# Altium project Main_Board.PrjPcb (part 11 of 44)

## Sheet SPI_Muxes.SchDoc: SPI_Muxes
size A3; Organization: Altium Limited; Address1: L3, 12a Rodborough Rd; Address2: Frenchs Forest; Address3: NSW; Address4: Australia 2086
Used 2 times, as channels HighSpeed/SPI_bridge_PCIe, SPI_bridge_Main. Parts and nets are listed once, with the designators drawn on the sheet.
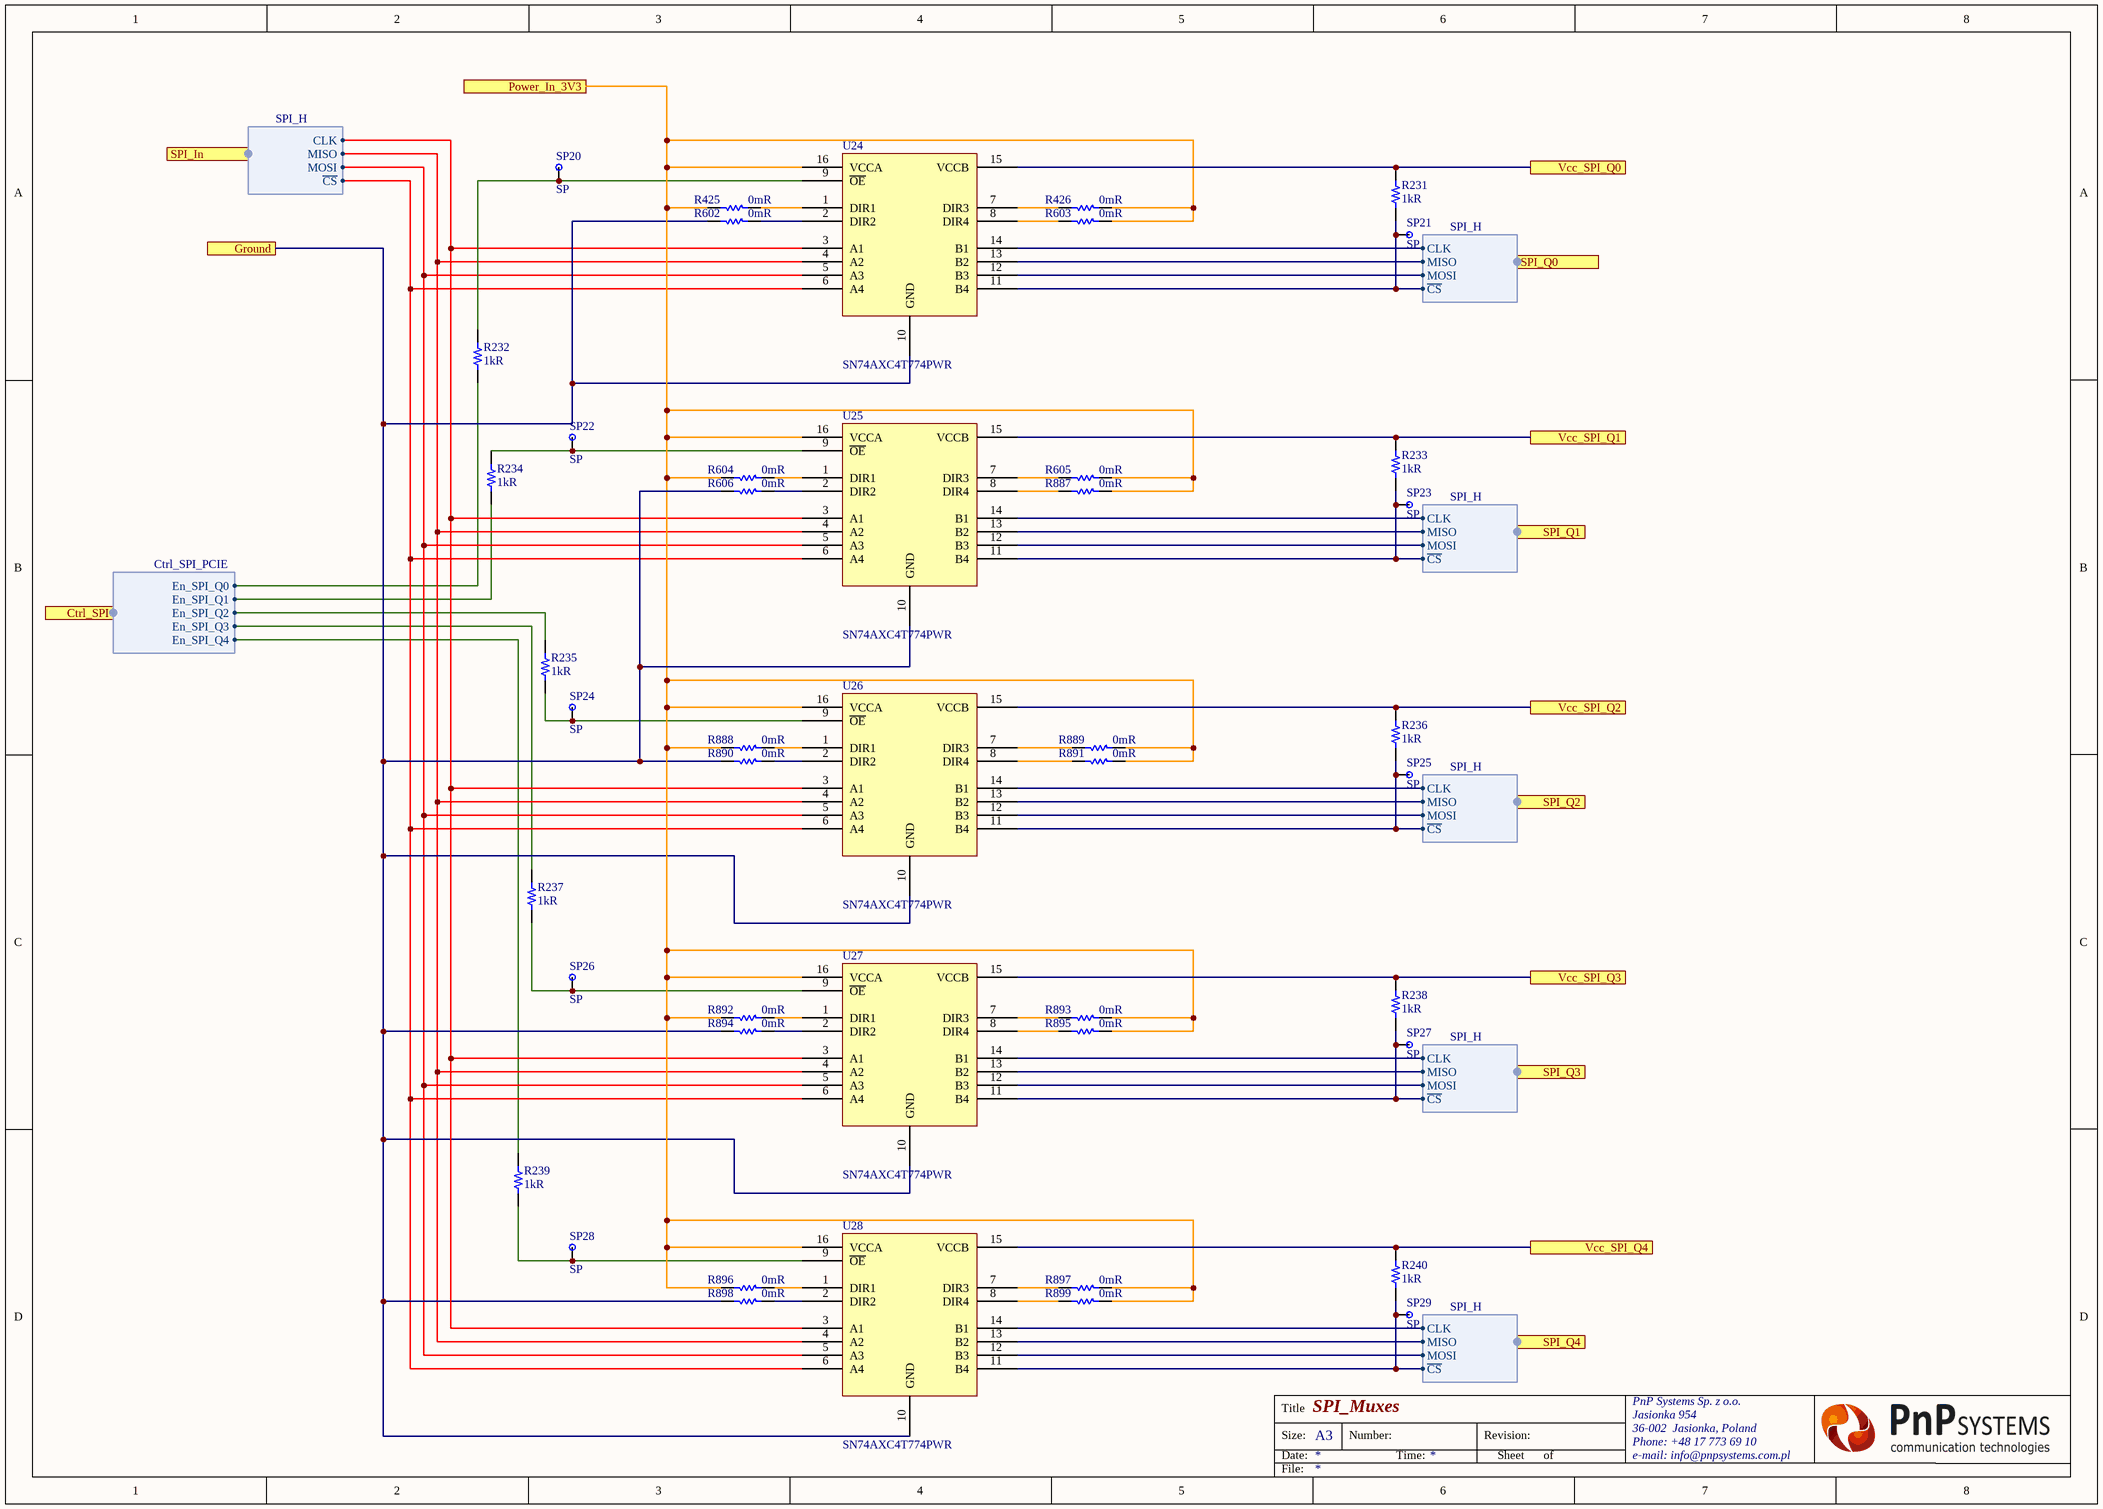
[diagram p17: SPI_Muxes.SchDoc]

### Parts
R231  1kR  [RES 0402/1005 RF KK]
R232  1kR  [RES 0402/1005 RF KK]
R233  1kR  [RES 0402/1005 RF KK]
R234  1kR  [RES 0402/1005 RF KK]
R235  1kR  [RES 0402/1005 RF KK]
R236  1kR  [RES 0402/1005 RF KK]
R237  1kR  [RES 0402/1005 RF KK]
R238  1kR  [RES 0402/1005 RF KK]
R239  1kR  [RES 0402/1005 RF KK]
R240  1kR  [RES 0402/1005 RF KK]
R425  0mR  [RES 0402/1005 RF KK]
R426  0mR  [RES 0402/1005 RF KK]
R602  0mR  [RES 0402/1005 RF KK]
R603  0mR  [RES 0402/1005 RF KK]
R604  0mR  [RES 0402/1005 RF KK]
R605  0mR  [RES 0402/1005 RF KK]
R606  0mR  [RES 0402/1005 RF KK]
R887  0mR  [RES 0402/1005 RF KK]
R888  0mR  [RES 0402/1005 RF KK]
R889  0mR  [RES 0402/1005 RF KK]
R890  0mR  [RES 0402/1005 RF KK]
R891  0mR  [RES 0402/1005 RF KK]
R892  0mR  [RES 0402/1005 RF KK]
R893  0mR  [RES 0402/1005 RF KK]
R894  0mR  [RES 0402/1005 RF KK]
R895  0mR  [RES 0402/1005 RF KK]
R896  0mR  [RES 0402/1005 RF KK]
R897  0mR  [RES 0402/1005 RF KK]
R898  0mR  [RES 0402/1005 RF KK]
R899  0mR  [RES 0402/1005 RF KK]
SP20  SP  [MeasureTP]
SP21  SP  [MeasureTP]
SP22  SP  [MeasureTP]
SP23  SP  [MeasureTP]
SP24  SP  [MeasureTP]
SP25  SP  [MeasureTP]
SP26  SP  [MeasureTP]
SP27  SP  [MeasureTP]
SP28  SP  [MeasureTP]
SP29  SP  [MeasureTP]
U24  SN74AXC4T774PWR  [SN74AXC4T774PWR]
U25  SN74AXC4T774PWR  [SN74AXC4T774PWR]
U26  SN74AXC4T774PWR  [SN74AXC4T774PWR]
U27  SN74AXC4T774PWR  [SN74AXC4T774PWR]
U28  SN74AXC4T774PWR  [SN74AXC4T774PWR]

### Ports
Ctrl_SPI (harness Ctrl_SPI_PCIE), Ground, Power_In_3V3, SPI_In (harness SPI_H), SPI_Q0 (harness SPI_H), SPI_Q1 (harness SPI_H), SPI_Q2 (harness SPI_H), SPI_Q3 (harness SPI_H), SPI_Q4 (harness SPI_H), Vcc_SPI_Q0, Vcc_SPI_Q1, Vcc_SPI_Q2, Vcc_SPI_Q3, Vcc_SPI_Q4

### Harnesses
SPI_H: CLK, MISO, MOSI, ~{CS}
Ctrl_SPI_PCIE: En_SPI_Q0, En_SPI_Q1, En_SPI_Q2, En_SPI_Q3, En_SPI_Q4

### Nets
Ground: R602.2 R606.2 R890.2 R894.2 R898.2 U24.10(GND) U25.10(GND) U26.10(GND) U27.10(GND) U28.10(GND) ; port Ground
Power_In_3V3: R425.2 R426.1 R603.1 R604.2 R605.1 R887.1 R888.2 R889.1 R891.1 R892.2 R893.1 R895.1 R896.2 R897.1 R899.1 U24.16(VCCA) U25.16(VCCA) U26.16(VCCA) U27.16(VCCA) U28.16(VCCA) ; port Power_In_3V3
Vcc_SPI_Q0: R231.2 U24.15(VCCB) ; port Vcc_SPI_Q0
Vcc_SPI_Q1: R233.2 U25.15(VCCB) ; port Vcc_SPI_Q1
Vcc_SPI_Q2: R236.2 U26.15(VCCB) ; port Vcc_SPI_Q2
Vcc_SPI_Q3: R238.2 U27.15(VCCB) ; port Vcc_SPI_Q3
Vcc_SPI_Q4: R240.2 U28.15(VCCB) ; port Vcc_SPI_Q4
NetR231_1: R231.1 SP21.1 U24.11(B4) ; port SPI_Q0.~{CS}
NetR232_1: R232.1 ; port Ctrl_SPI.En_SPI_Q0
NetR232_2: R232.2 SP20.1 U24.9(~{OE})
NetR233_1: R233.1 SP23.1 U25.11(B4) ; port SPI_Q1.~{CS}
NetR234_1: R234.1 ; port Ctrl_SPI.En_SPI_Q1
NetR234_2: R234.2 SP22.1 U25.9(~{OE})
NetR235_1: R235.1 SP24.1 U26.9(~{OE})
NetR235_2: R235.2 ; port Ctrl_SPI.En_SPI_Q2
NetR236_1: R236.1 SP25.1 U26.11(B4) ; port SPI_Q2.~{CS}
NetR237_1: R237.1 SP26.1 U27.9(~{OE})
NetR237_2: R237.2 ; port Ctrl_SPI.En_SPI_Q3
NetR238_1: R238.1 SP27.1 U27.11(B4) ; port SPI_Q3.~{CS}
NetR239_1: R239.1 ; port Ctrl_SPI.En_SPI_Q4
NetR239_2: R239.2 SP28.1 U28.9(~{OE})
NetR240_1: R240.1 SP29.1 U28.11(B4) ; port SPI_Q4.~{CS}
NetR425_1: R425.1 U24.1(DIR1)
NetR426_2: R426.2 U24.7(DIR3)
NetR602_1: R602.1 U24.2(DIR2)
NetR603_2: R603.2 U24.8(DIR4)
NetR604_1: R604.1 U25.1(DIR1)
NetR605_2: R605.2 U25.7(DIR3)
NetR606_1: R606.1 U25.2(DIR2)
NetR887_2: R887.2 U25.8(DIR4)
NetR888_1: R888.1 U26.1(DIR1)
NetR889_2: R889.2 U26.7(DIR3)
NetR890_1: R890.1 U26.2(DIR2)
NetR891_2: R891.2 U26.8(DIR4)
NetR892_1: R892.1 U27.1(DIR1)
NetR893_2: R893.2 U27.7(DIR3)
NetR894_1: R894.1 U27.2(DIR2)
NetR895_2: R895.2 U27.8(DIR4)
NetR896_1: R896.1 U28.1(DIR1)
NetR897_2: R897.2 U28.7(DIR3)
NetR898_1: R898.1 U28.2(DIR2)
NetR899_2: R899.2 U28.8(DIR4)
NetU24_3: U24.3(A1) U25.3(A1) U26.3(A1) U27.3(A1) U28.3(A1) ; port SPI_In.CLK
NetU24_4: U24.4(A2) U25.4(A2) U26.4(A2) U27.4(A2) U28.4(A2) ; port SPI_In.MISO
NetU24_5: U24.5(A3) U25.5(A3) U26.5(A3) U27.5(A3) U28.5(A3) ; port SPI_In.MOSI
NetU24_6: U24.6(A4) U25.6(A4) U26.6(A4) U27.6(A4) U28.6(A4) ; port SPI_In.~{CS}
NetU24_12: U24.12(B3) ; port SPI_Q0.MOSI
NetU24_13: U24.13(B2) ; port SPI_Q0.MISO
NetU24_14: U24.14(B1) ; port SPI_Q0.CLK
NetU25_12: U25.12(B3) ; port SPI_Q1.MOSI
NetU25_13: U25.13(B2) ; port SPI_Q1.MISO
NetU25_14: U25.14(B1) ; port SPI_Q1.CLK
NetU26_12: U26.12(B3) ; port SPI_Q2.MOSI
NetU26_13: U26.13(B2) ; port SPI_Q2.MISO
NetU26_14: U26.14(B1) ; port SPI_Q2.CLK
NetU27_12: U27.12(B3) ; port SPI_Q3.MOSI
NetU27_13: U27.13(B2) ; port SPI_Q3.MISO
NetU27_14: U27.14(B1) ; port SPI_Q3.CLK
NetU28_12: U28.12(B3) ; port SPI_Q4.MOSI
NetU28_13: U28.13(B2) ; port SPI_Q4.MISO
NetU28_14: U28.14(B1) ; port SPI_Q4.CLK

### Channels
HighSpeed/SPI_bridge_PCIe: designators end in _SPI_bridge_PCIe; ports Ground=B503_Ground Power_In_3V3=3V3_RAIL Vcc_SPI_Q0=3V3_RAIL Vcc_SPI_Q1=3V3_RAIL Vcc_SPI_Q2=3V3_RAIL Vcc_SPI_Q3=3V3_RAIL Vcc_SPI_Q4=3V3_RAIL
SPI_bridge_Main: designators end in _SPI_bridge_Main; ports Ground=B503_Ground Power_In_3V3=3V3_RAIL Vcc_SPI_Q0=3V3_RAIL Vcc_SPI_Q1=3V3_RAIL Vcc_SPI_Q2=3V3_RAIL Vcc_SPI_Q3=3V3_RAIL Vcc_SPI_Q4=3V3_RAIL

### Notes on the sheet
- Title
- Size:
- Date:
- A3
- Number:
- Time:
- Revision:
- Sheet
- of
- File:

### Library data of the parts
R231-R240 = Resistor: Manufacturer: Panasonic; Manufacturer Part Number: ERJ-2RKF1001X; Tolerance: 1%; Power Rating: 100mW; Temperature Coefficient: 100ppm/°C; Voltage Rating: 50V; Supplier 1: Digi-Key; Supplier Part Number 1: P1.00KLCT-ND; Stock 1: 6683975; Pricing 1: 1 = 0,10000, 10 = 0,05200, 100 = 0,02130, 1000 = 0,00958, 2500 = 0,00832, 5000 = 0,00687 (USD); RoHS: Yes; Mount: Surface Mount; Case/Package: 0402; Number of Pins: 2; Case Code (Imperial): 0402; Case Code (Metric): 1005; Contact Plating: Tin; Min Operating Temperature: -55°C; Max Operating Temperature: 155°C; Resistance: 1kR; Packaging: Tape and Reel; Composition: Thick Film; Termination: SMD/SMT; Package Quantity: 1; Military Standard: Not; Number of Terminations: 2; Max Power Dissipation: 100mW; Voltage Rating (DC): 50V; Features: Automotive AEC-Q200; Working Voltage: 50V; Length: 1mm; Height: 0.35mm; Width: 0.5mm; Depth: 0.5mm; Radiation Hardening: No; Lead Free: Lead Free; REACH SVHC: No SVHC; ComponentLink1URL: https://datasheet.ciiva.com/11821/0900766b80f80784-11821203.pdf?src-supplier=RSComponents; ComponentLink1Description: https://datasheet.ciiva.com/11821/0900766b80f80784-11821203.pdf?src-supplier=RSComponents; ComponentLink2URL: https://datasheet.ciiva.com/16767/70260748-16767559.pdf?src-supplier=Allied+Electronics; ComponentLink2Description: https://datasheet.ciiva.com/16767/70260748-16767559.pdf?src-supplier=Allied+Electronics; ComponentLink3URL: https://datasheet.ciiva.com/9198/aoa0000ce2-9198920.pdf?src-supplier=Avnet; ComponentLink3Description: https://datasheet.ciiva.com/9198/aoa0000ce2-9198920.pdf?src-supplier=Avnet; ComponentLink4URL: https://datasheet.ciiva.com/7942/aoa0000ce2-7942426.pdf?src-supplier=Element14; ComponentLink4Description: https://datasheet.ciiva.com/7942/aoa0000ce2-7942426.pdf?src-supplier=Element14; ComponentLink5URL: https://datasheet.ciiva.com/16771/70260748-16771979.pdf?src-supplier=Allied+Electronics; ComponentLink5Description: https://datasheet.ciiva.com/16771/70260748-16771979.pdf?src-supplier=Allied+Electronics; ComponentLink6URL: https://datasheet.ciiva.com/17215/aoa0000ce2-17215308.pdf?src-supplier=Avnet+Europe; ComponentLink6Description: https://datasheet.ciiva.com/17215/aoa0000ce2-17215308.pdf?src-supplier=Avnet+Europe; ComponentLink7URL: https://datasheet.ciiva.com/28532/1678782-28532109.pdf?src-supplier=Element14; ComponentLink7Description: https://datasheet.ciiva.com/28532/1678782-28532109.pdf?src-supplier=Element14; ComponentLink8URL: https://datasheet.ciiva.com/16523/aoa0000ce2-16523834.pdf?src-supplier=Avnet+Asia; ComponentLink8Description: https://datasheet.ciiva.com/16523/aoa0000ce2-16523834.pdf?src-supplier=Avnet+Asia; ComponentLink9URL: https://datasheet.ciiva.com/22673/1678782-22673916.pdf?src-supplier=Element14; ComponentLink9Description: https://datasheet.ciiva.com/22673/1678782-22673916.pdf?src-supplier=Element14
R425 R426 R602-R606 R887-R899 = Resistor: Manufacturer 1: Yageo; Manufacturer Part Number 1: RC0402JR-070RL; Power Rating: 62.5mW; Tolerance: 5%; Voltage Rating: 50V; Max Power Dissipation: 63mW; Temperature Coefficient: 200ppm/°C; Supplier 1: Digi-Key; Supplier Part Number 1: 311-0.0JRCT-ND; Stock 1: 69822252; Pricing 1: 1=0.10000, 10=0.01200, 25=0.00920, 50=0.00680, 100=0.00510, 250=0.00388, 500=0.00308, 1000=0.00227, 5000=0.00163 (USD); RoHS: Yes; Case/Package: 0402; Contact Plating: Tin,Matte; Case Code (Metric): 1005; Case Code (Imperial): 0402; Min Operating Temperature: -55°C; Max Operating Temperature: 155°C; Resistance: 0mR; Packaging: Tape and Reel; Composition: Thick Film; Package Quantity: 1; Number of Terminations: 2; Termination: SMD/SMT; Military Standard: Not; Features: Moisture Resistant; Length: 1mm; Height: 0.016inch; Width: 0.02inch; Depth: 0.5mm; Radiation Hardening: No; REACH SVHC: Unknown; Lead Free: Lead Free; ComponentLink1URL: https://datasheet.ciiva.com/2452/pyu-rc0402-51-rohs-l-6-2452608.pdf?src-supplier=Digi-Key; ComponentLink1Description: https://datasheet.ciiva.com/2452/pyu-rc0402-51-rohs-l-6-2452608.pdf?src-supplier=Digi-Key; ComponentLink2URL: https://datasheet.ciiva.com/11808/0900766b80c66297-11808195.pdf?src-supplier=RSComponents; ComponentLink2Description: https://datasheet.ciiva.com/11808/0900766b80c66297-11808195.pdf?src-supplier=RSComponents; ComponentLink3URL: https://datasheet.ciiva.com/2452/pyu-r-int-thick-7-2452609.pdf?src-supplier=Digi-Key; ComponentLink3Description: https://datasheet.ciiva.com/2452/pyu-r-int-thick-7-2452609.pdf?src-supplier=Digi-Key; ComponentLink4URL: https://datasheet.ciiva.com/22747/1018594-22747515.pdf?src-supplier=Element14; ComponentLink4Description: https://datasheet.ciiva.com/22747/1018594-22747515.pdf?src-supplier=Element14; ComponentLink5URL: https://datasheet.ciiva.com/7983/1018594-7983535.pdf?src-supplier=Element14; ComponentLink5Description: https://datasheet.ciiva.com/7983/1018594-7983535.pdf?src-supplier=Element14; ComponentLink6URL: https://datasheet.ciiva.com/2452/pyu-r-int-thick-7-2452610.pdf?src-supplier=Digi-Key; ComponentLink6Description: https://datasheet.ciiva.com/2452/pyu-r-int-thick-7-2452610.pdf?src-supplier=Digi-Key; ComponentLink7URL: https://datasheet.ciiva.com/8896/pyu-rc0402-51-rohs-l-6-8896201.pdf?src-supplier=Avnet; ComponentLink7Description: https://datasheet.ciiva.com/8896/pyu-rc0402-51-rohs-l-6-8896201.pdf?src-supplier=Avnet; ComponentLink8URL: https://datasheet.ciiva.com/28386/pyu-rc0402-51-rohs-l-6-28386633.pdf?src-supplier=Avnet+Europe; ComponentLink8Description: https://datasheet.ciiva.com/28386/pyu-rc0402-51-rohs-l-6-28386633.pdf?src-supplier=Avnet+Europe; ComponentLink9URL: https://datasheet.ciiva.com/15189/getdatasheetpartid-326379-15189533.pdf?src-supplier=Verical; ComponentLink9Description: https://datasheet.ciiva.com/15189/getdatasheetpartid-326379-15189533.pdf?src-supplier=Verical
U24-U28 = SN74AXC4T774PWR: Manufacturer 1: Texas Instruments; Supplier 1: Digi-Key; Manufacturer Part Number 1: SN74AXC4T774PWR; Stock 1: 2000; Pricing 1: 1=1,14000, 10=1,01500, 100=0,79120, 500=0,65364, 1000=0,51603 (USD); RoHS: No; Supplier Part Number 1: 296-SN74AXC4T774PWRCT-ND

## Sheet Power4HiSpeed.SchDoc
size A3; Organization: Altium Limited; Address1: L3, 12a Rodborough Rd; Address2: Frenchs Forest; Address3: NSW; Address4: Australia 2086
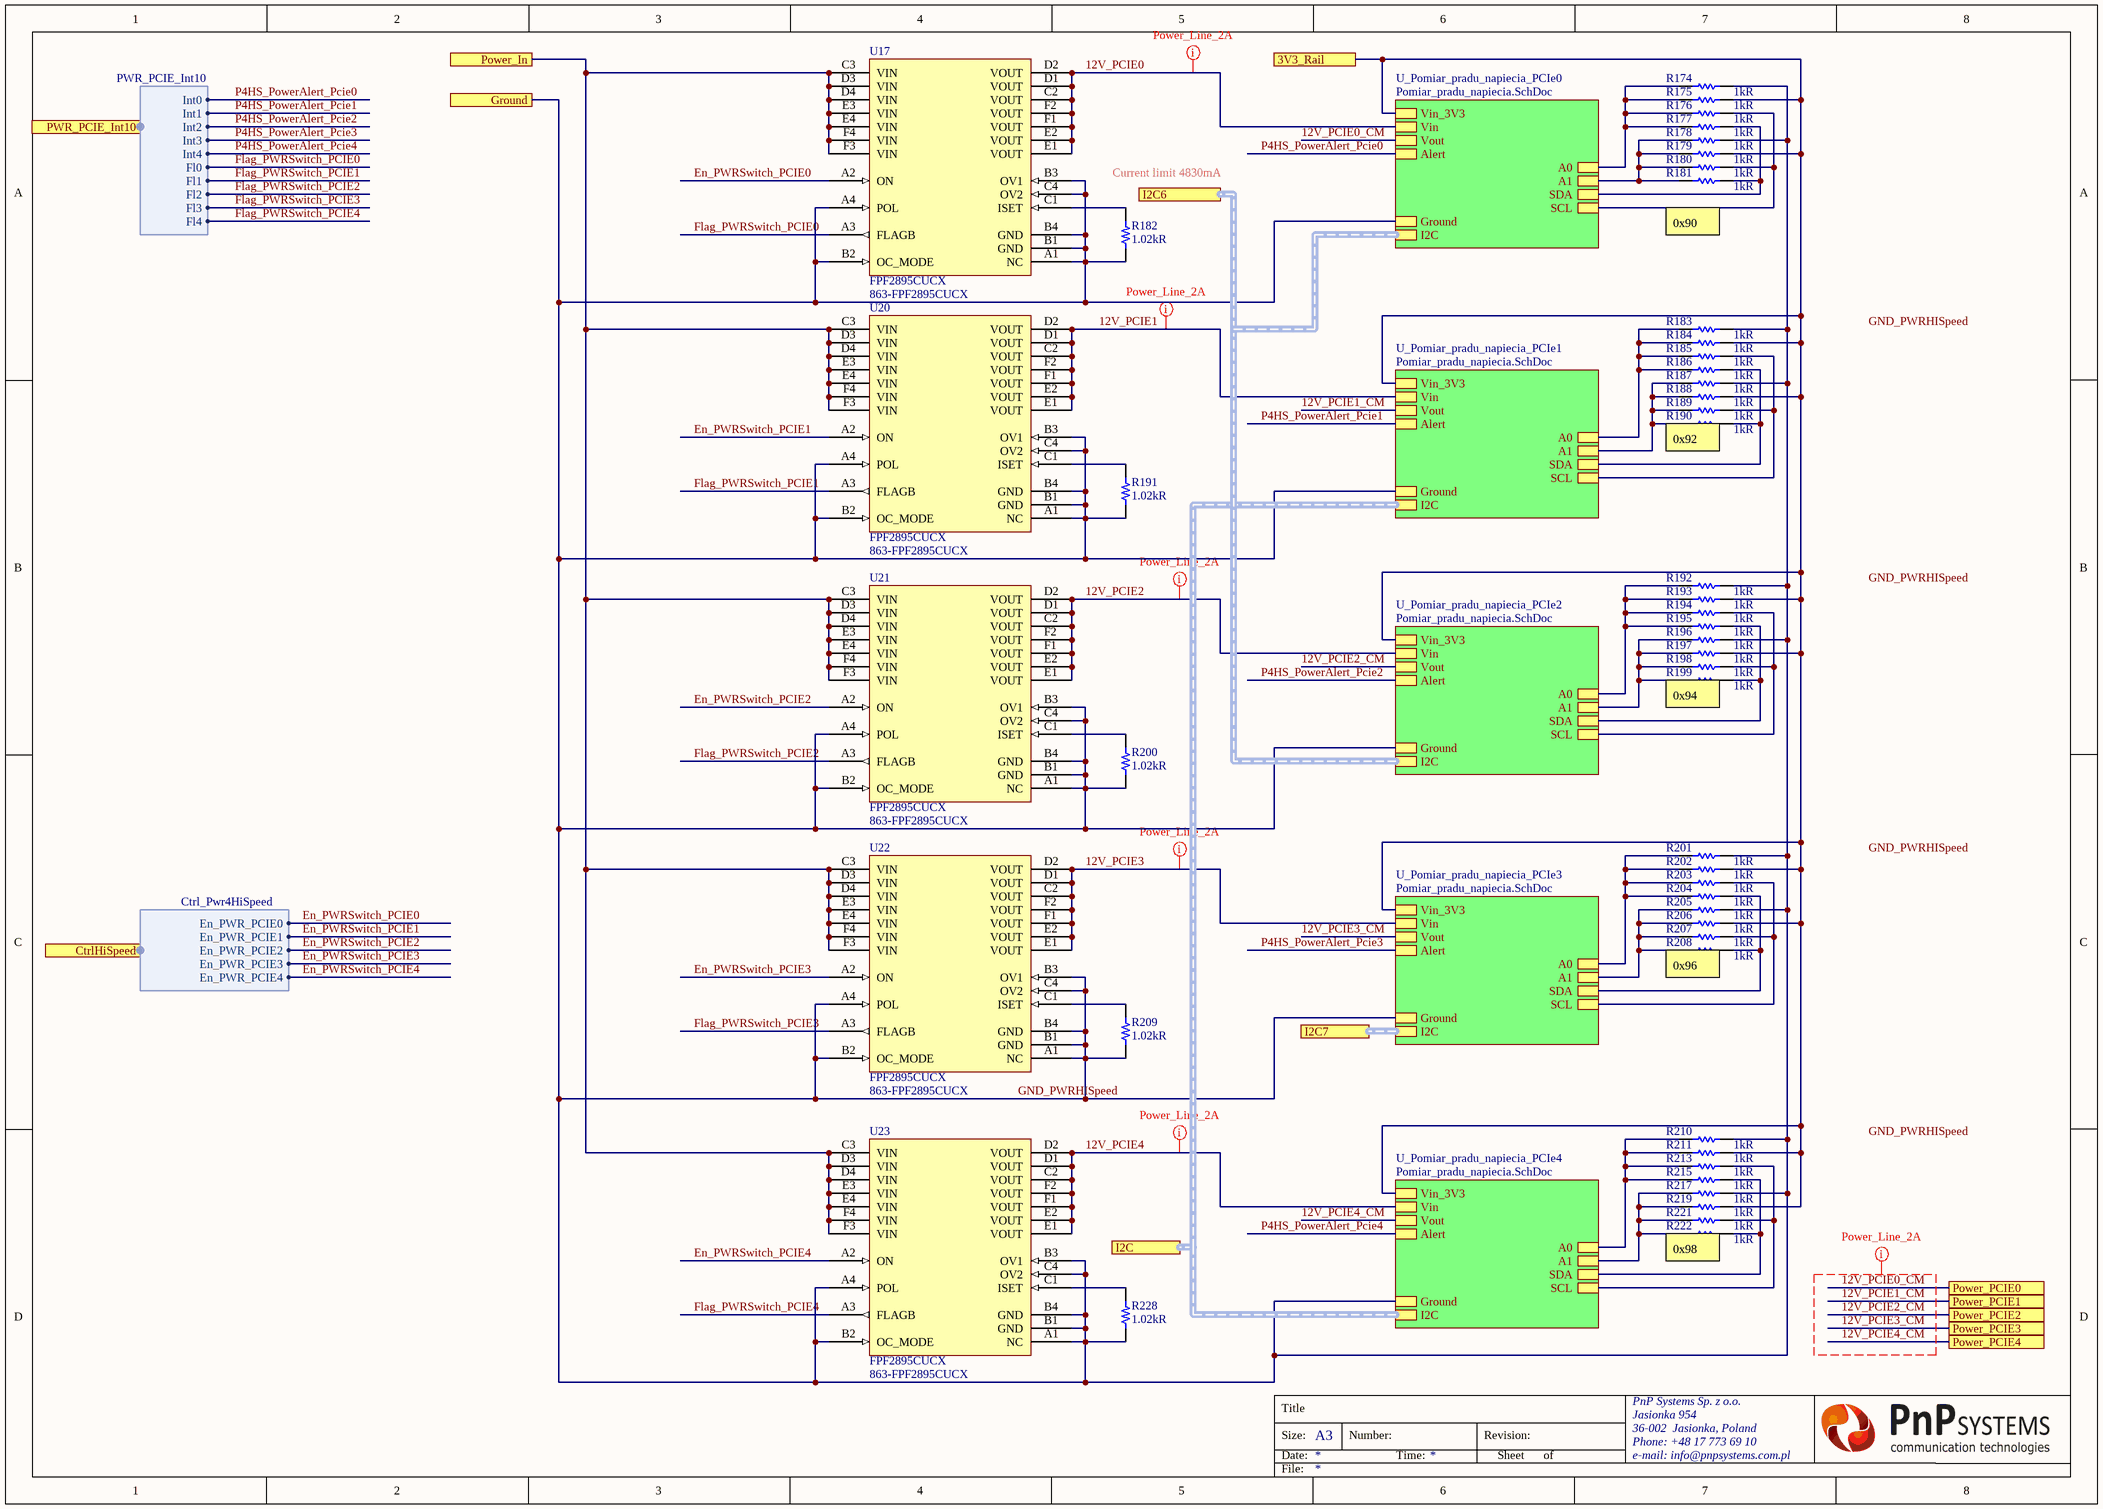
[diagram p18: Power4HiSpeed.SchDoc]

### Parts
R174  1kR  [RES 0402/1005 RF KK]
R175  1kR  [RES 0402/1005 RF KK]
R176  1kR  [RES 0402/1005 RF KK]
R177  1kR  [RES 0402/1005 RF KK]
R178  1kR  [RES 0402/1005 RF KK]
R179  1kR  [RES 0402/1005 RF KK]
R180  1kR  [RES 0402/1005 RF KK]
R181  1kR  [RES 0402/1005 RF KK]
R182  1.02kR  [RES 0402/1005 RF KK]
R183  1kR  [RES 0402/1005 RF KK]
R184  1kR  [RES 0402/1005 RF KK]
R185  1kR  [RES 0402/1005 RF KK]
R186  1kR  [RES 0402/1005 RF KK]
R187  1kR  [RES 0402/1005 RF KK]
R188  1kR  [RES 0402/1005 RF KK]
R189  1kR  [RES 0402/1005 RF KK]
R190  1kR  [RES 0402/1005 RF KK]
R191  1.02kR  [RES 0402/1005 RF KK]
R192  1kR  [RES 0402/1005 RF KK]
R193  1kR  [RES 0402/1005 RF KK]
R194  1kR  [RES 0402/1005 RF KK]
R195  1kR  [RES 0402/1005 RF KK]
R196  1kR  [RES 0402/1005 RF KK]
R197  1kR  [RES 0402/1005 RF KK]
R198  1kR  [RES 0402/1005 RF KK]
R199  1kR  [RES 0402/1005 RF KK]
R200  1.02kR  [RES 0402/1005 RF KK]
R201  1kR  [RES 0402/1005 RF KK]
R202  1kR  [RES 0402/1005 RF KK]
R203  1kR  [RES 0402/1005 RF KK]
R204  1kR  [RES 0402/1005 RF KK]
R205  1kR  [RES 0402/1005 RF KK]
R206  1kR  [RES 0402/1005 RF KK]
R207  1kR  [RES 0402/1005 RF KK]
R208  1kR  [RES 0402/1005 RF KK]
R209  1.02kR  [RES 0402/1005 RF KK]
R210  1kR  [RES 0402/1005 RF KK]
R211  1kR  [RES 0402/1005 RF KK]
R213  1kR  [RES 0402/1005 RF KK]
R215  1kR  [RES 0402/1005 RF KK]
R217  1kR  [RES 0402/1005 RF KK]
R219  1kR  [RES 0402/1005 RF KK]
R221  1kR  [RES 0402/1005 RF KK]
R222  1kR  [RES 0402/1005 RF KK]
R228  1.02kR  [RES 0402/1005 RF KK]
U17  FPF2895CUCX  Supplier Part Number 1: 863-FPF2895CUCX  [FPF2895C-D]
U20  FPF2895CUCX  Supplier Part Number 1: 863-FPF2895CUCX  [FPF2895C-D]
U21  FPF2895CUCX  Supplier Part Number 1: 863-FPF2895CUCX  [FPF2895C-D]
U22  FPF2895CUCX  Supplier Part Number 1: 863-FPF2895CUCX  [FPF2895C-D]
U23  FPF2895CUCX  Supplier Part Number 1: 863-FPF2895CUCX  [FPF2895C-D]

### Sub-sheets
U_Pomiar_pradu_napiecia_PCIe0 = Pomiar_pradu_napiecia.SchDoc: Vin_3V3, Vin, Vout, Alert, A0, A1, SDA, SCL, Ground, I2C (harness I2C)
U_Pomiar_pradu_napiecia_PCIe1 = Pomiar_pradu_napiecia.SchDoc: Vin_3V3, Vin, Vout, Alert, A0, A1, SDA, SCL, Ground, I2C (harness I2C)
U_Pomiar_pradu_napiecia_PCIe2 = Pomiar_pradu_napiecia.SchDoc: Vin_3V3, Vin, Vout, Alert, A0, A1, SDA, SCL, Ground, I2C (harness I2C)
U_Pomiar_pradu_napiecia_PCIe3 = Pomiar_pradu_napiecia.SchDoc: Vin_3V3, Vin, Vout, Alert, A0, A1, SDA, SCL, Ground, I2C (harness I2C)
U_Pomiar_pradu_napiecia_PCIe4 = Pomiar_pradu_napiecia.SchDoc: Vin_3V3, Vin, Vout, Alert, A0, A1, SDA, SCL, Ground, I2C (harness I2C)

### Ports
3V3_Rail, CtrlHiSpeed (harness Ctrl_Pwr4HiSpeed), Ground, I2C6, I2C7, I2C (harness I2C), Power_In, Power_PCIE0, Power_PCIE1, Power_PCIE2, Power_PCIE3, Power_PCIE4, PWR_PCIE_Int10 (harness PWR_PCIE_Int10)

### Harnesses
Ctrl_Pwr4HiSpeed: En_PWR_PCIE0, En_PWR_PCIE1, En_PWR_PCIE2, En_PWR_PCIE3, En_PWR_PCIE4
PWR_PCIE_Int10: Int0, Int1, Int2, Int3, Int4, Fl0, Fl1, Fl2, Fl3, Fl4

### Nets
GND_PWRHISpeed: R174.2 R178.2 R182.1 R183.2 R187.2 R191.1 R192.2 R196.2 R200.1 R201.2 R205.2 R209.1 R210.2 R217.2 R228.1 U17.A1(NC) U17.A4(POL) U17.B1(GND) U17.B2(OC_MODE) U17.B3(OV1) U17.B4(GND) U17.C4(OV2) U20.A1(NC) U20.A4(POL) U20.B1(GND) U20.B2(OC_MODE) U20.B3(OV1) U20.B4(GND) U20.C4(OV2) U21.A1(NC) U21.A4(POL) U21.B1(GND) U21.B2(OC_MODE) U21.B3(OV1) U21.B4(GND) U21.C4(OV2) U22.A1(NC) U22.A4(POL) U22.B1(GND) U22.B2(OC_MODE) U22.B3(OV1) U22.B4(GND) U22.C4(OV2) U23.A1(NC) U23.A4(POL) U23.B1(GND) U23.B2(OC_MODE) U23.B3(OV1) U23.B4(GND) U23.C4(OV2) ; port Ground, sheet U_Pomiar_pradu_napiecia_PCIe0/Ground, sheet U_Pomiar_pradu_napiecia_PCIe1/Ground, sheet U_Pomiar_pradu_napiecia_PCIe2/Ground, sheet U_Pomiar_pradu_napiecia_PCIe3/Ground, sheet U_Pomiar_pradu_napiecia_PCIe4/Ground  [project net B503_Ground]
3V3_RAIL: R175.2 R179.2 R184.2 R188.2 R193.2 R197.2 R202.2 R206.2 R211.2 R219.2 ; port 3V3_Rail, sheet U_Pomiar_pradu_napiecia_PCIe0/Vin_3V3, sheet U_Pomiar_pradu_napiecia_PCIe1/Vin_3V3, sheet U_Pomiar_pradu_napiecia_PCIe2/Vin_3V3, sheet U_Pomiar_pradu_napiecia_PCIe3/Vin_3V3, sheet U_Pomiar_pradu_napiecia_PCIe4/Vin_3V3
12V_LT3042: U17.C3(VIN) U17.D3(VIN) U17.D4(VIN) U17.E3(VIN) U17.E4(VIN) U17.F3(VIN) U17.F4(VIN) U20.C3(VIN) U20.D3(VIN) U20.D4(VIN) U20.E3(VIN) U20.E4(VIN) U20.F3(VIN) U20.F4(VIN) U21.C3(VIN) U21.D3(VIN) U21.D4(VIN) U21.E3(VIN) U21.E4(VIN) U21.F3(VIN) U21.F4(VIN) U22.C3(VIN) U22.D3(VIN) U22.D4(VIN) U22.E3(VIN) U22.E4(VIN) U22.F3(VIN) U22.F4(VIN) U23.C3(VIN) U23.D3(VIN) U23.D4(VIN) U23.E3(VIN) U23.E4(VIN) U23.F3(VIN) U23.F4(VIN) ; port Power_In
12V_PCIE0: U17.C2(VOUT) U17.D1(VOUT) U17.D2(VOUT) U17.E1(VOUT) U17.E2(VOUT) U17.F1(VOUT) U17.F2(VOUT) ; sheet U_Pomiar_pradu_napiecia_PCIe0/Vin
12V_PCIE0_CM: port Power_PCIE0, sheet U_Pomiar_pradu_napiecia_PCIe0/Vout
12V_PCIE1: U20.C2(VOUT) U20.D1(VOUT) U20.D2(VOUT) U20.E1(VOUT) U20.E2(VOUT) U20.F1(VOUT) U20.F2(VOUT) ; sheet U_Pomiar_pradu_napiecia_PCIe1/Vin
12V_PCIE1_CM: port Power_PCIE1, sheet U_Pomiar_pradu_napiecia_PCIe1/Vout
12V_PCIE2: U21.C2(VOUT) U21.D1(VOUT) U21.D2(VOUT) U21.E1(VOUT) U21.E2(VOUT) U21.F1(VOUT) U21.F2(VOUT) ; sheet U_Pomiar_pradu_napiecia_PCIe2/Vin
12V_PCIE2_CM: port Power_PCIE2, sheet U_Pomiar_pradu_napiecia_PCIe2/Vout
12V_PCIE3: U22.C2(VOUT) U22.D1(VOUT) U22.D2(VOUT) U22.E1(VOUT) U22.E2(VOUT) U22.F1(VOUT) U22.F2(VOUT) ; sheet U_Pomiar_pradu_napiecia_PCIe3/Vin
12V_PCIE3_CM: port Power_PCIE3, sheet U_Pomiar_pradu_napiecia_PCIe3/Vout
12V_PCIE4: U23.C2(VOUT) U23.D1(VOUT) U23.D2(VOUT) U23.E1(VOUT) U23.E2(VOUT) U23.F1(VOUT) U23.F2(VOUT) ; sheet U_Pomiar_pradu_napiecia_PCIe4/Vin
12V_PCIE4_CM: port Power_PCIE4, sheet U_Pomiar_pradu_napiecia_PCIe4/Vout
En_PWRSwitch_PCIE0: U17.A2(ON) ; port CtrlHiSpeed.En_PWR_PCIE0
En_PWRSwitch_PCIE1: U20.A2(ON) ; port CtrlHiSpeed.En_PWR_PCIE1
En_PWRSwitch_PCIE2: U21.A2(ON) ; port CtrlHiSpeed.En_PWR_PCIE2
En_PWRSwitch_PCIE3: U22.A2(ON) ; port CtrlHiSpeed.En_PWR_PCIE3  [project net EN_PWR_PCIE_3]
En_PWRSwitch_PCIE4: U23.A2(ON) ; port CtrlHiSpeed.En_PWR_PCIE4  [project net EN_PWR_PCIE_4]
Flag_PWRSwitch_PCIE0: U17.A3(FLAGB) ; port PWR_PCIE_Int10.Fl0
Flag_PWRSwitch_PCIE1: U20.A3(FLAGB) ; port PWR_PCIE_Int10.Fl1
Flag_PWRSwitch_PCIE2: U21.A3(FLAGB) ; port PWR_PCIE_Int10.Fl2
Flag_PWRSwitch_PCIE3: U22.A3(FLAGB) ; port PWR_PCIE_Int10.Fl3
Flag_PWRSwitch_PCIE4: U23.A3(FLAGB) ; port PWR_PCIE_Int10.Fl4
HiSpeedModule_I2C0.SCL: R185.2 R189.2 R213.2 R221.2 ; sheet U_Pomiar_pradu_napiecia_PCIe1/SCL, sheet U_Pomiar_pradu_napiecia_PCIe4/SCL
HiSpeedModule_I2C0.SDA: R186.2 R190.2 R215.2 R222.2 ; sheet U_Pomiar_pradu_napiecia_PCIe1/SDA, sheet U_Pomiar_pradu_napiecia_PCIe4/SDA
HiSpeedModule_I2C6.SCL: R176.2 R180.2 R194.2 R198.2 ; sheet U_Pomiar_pradu_napiecia_PCIe0/SCL, sheet U_Pomiar_pradu_napiecia_PCIe2/SCL
HiSpeedModule_I2C6.SDA: R177.2 R181.2 R195.2 R199.2 ; sheet U_Pomiar_pradu_napiecia_PCIe0/SDA, sheet U_Pomiar_pradu_napiecia_PCIe2/SDA
HiSpeedModule_I2C7.SCL: R203.2 R207.2 ; sheet U_Pomiar_pradu_napiecia_PCIe3/SCL
HiSpeedModule_I2C7.SDA: R204.2 R208.2 ; sheet U_Pomiar_pradu_napiecia_PCIe3/SDA
P4HS_PowerAlert_Pcie0: sheet U_Pomiar_pradu_napiecia_PCIe0/Alert, port PWR_PCIE_Int10.Int0
P4HS_PowerAlert_Pcie1: sheet U_Pomiar_pradu_napiecia_PCIe1/Alert, port PWR_PCIE_Int10.Int1
P4HS_PowerAlert_Pcie2: sheet U_Pomiar_pradu_napiecia_PCIe2/Alert, port PWR_PCIE_Int10.Int2
P4HS_PowerAlert_Pcie3: sheet U_Pomiar_pradu_napiecia_PCIe3/Alert, port PWR_PCIE_Int10.Int3
P4HS_PowerAlert_Pcie4: sheet U_Pomiar_pradu_napiecia_PCIe4/Alert, port PWR_PCIE_Int10.Int4
NetR174_1: R174.1 R175.1 R176.1 R177.1 ; sheet U_Pomiar_pradu_napiecia_PCIe0/A0
NetR178_1: R178.1 R179.1 R180.1 R181.1 ; sheet U_Pomiar_pradu_napiecia_PCIe0/A1
NetR182_2: R182.2 U17.C1(ISET)
NetR183_1: R183.1 R184.1 R185.1 R186.1 ; sheet U_Pomiar_pradu_napiecia_PCIe1/A0
NetR187_1: R187.1 R188.1 R189.1 R190.1 ; sheet U_Pomiar_pradu_napiecia_PCIe1/A1
NetR191_2: R191.2 U20.C1(ISET)
NetR192_1: R192.1 R193.1 R194.1 R195.1 ; sheet U_Pomiar_pradu_napiecia_PCIe2/A0
NetR196_1: R196.1 R197.1 R198.1 R199.1 ; sheet U_Pomiar_pradu_napiecia_PCIe2/A1
NetR200_2: R200.2 U21.C1(ISET)
NetR201_1: R201.1 R202.1 R203.1 R204.1 ; sheet U_Pomiar_pradu_napiecia_PCIe3/A0
NetR205_1: R205.1 R206.1 R207.1 R208.1 ; sheet U_Pomiar_pradu_napiecia_PCIe3/A1
NetR209_2: R209.2 U22.C1(ISET)
NetR210_1: R210.1 R211.1 R213.1 R215.1 ; sheet U_Pomiar_pradu_napiecia_PCIe4/A0
NetR217_1: R217.1 R219.1 R221.1 R222.1 ; sheet U_Pomiar_pradu_napiecia_PCIe4/A1
NetR228_2: R228.2 U23.C1(ISET)

### Buses and harness runs
harness port I2C6 = sheet U_Pomiar_pradu_napiecia_PCIe0/I2C = sheet U_Pomiar_pradu_napiecia_PCIe2/I2C
harness port I2C7 = sheet U_Pomiar_pradu_napiecia_PCIe3/I2C
harness port I2C = sheet U_Pomiar_pradu_napiecia_PCIe1/I2C = sheet U_Pomiar_pradu_napiecia_PCIe4/I2C

### Layout directives
net class Power_Line_2A: 12V_PCIE0, 12V_PCIE0_CM, 12V_PCIE1, 12V_PCIE1_CM, 12V_PCIE2, 12V_PCIE2_CM, 12V_PCIE3, 12V_PCIE3_CM, 12V_PCIE4, 12V_PCIE4_CM

### Notes on the sheet
- (near R182) Current limit 4830mA
- 0x90
- (near R190) 0x92
- (near R199) 0x94
- (near R208) 0x96
- (near R222) 0x98
- Labels drawn without touching a wire or pin: GND_PWRHISpeed
- Title
- Size:
- Date:
- A3
- Number:
- Time:
- Revision:
- Sheet
- of
- File:

### Library data of the parts
R174-R181 R183-R190 R192-R199 R201-R208 R210 R211 R213 R215 R217 R219 R221 R222 = Resistor: PANASONIC - ERJ-2RKF1001X - SMD Chip Resistor, 0402 [1005 Metric], 1 kohm, ERJ2R Series, 50 V, Thick Film, 100 mW; Voltage Rating (DC): 50V; Temperature Coefficient: 100ppm/°C; Tolerance: 1%; Power Rating: 100mW; Supplier 1: Digi-Key; Supplier Part Number 1: P1.00KLDKR-ND; Manufacturer: Panasonic; Manufacturer Part Number: ERJ-2RKF1001X; RoHS: Yes; Category: Chip SMD Resistors; Stock 1: 1864188; Pricing 1: 1=0,10000, 10=0,04300, 100=0,01740, 1000=0,00782, 2500=0,00678, 5000=0,00561 (USD); Mount: Surface Mount; Case/Package: 0402; Number of Pins: 2; Case Code (Imperial): 0402; Case Code (Metric): 1005; Contact Plating: Tin; Min Operating Temperature: -55°C; Max Operating Temperature: 155°C; Termination: SMD/SMT; Composition: Thick Film; Number of Terminations: 2; Military Standard: Not; Features: Automotive AEC-Q200; Resistance: 1kR; Packaging: Tape and Reel; Voltage Rating: 50V; Package Quantity: 1; Max Power Dissipation: 100mW; Working Voltage: 50V; Length: 1mm; Height: 0.35mm; Depth: 0.5mm; Width: 0.5mm; Radiation Hardening: No; Lead Free: Lead Free; REACH SVHC: No SVHC; ComponentLink1URL: https://datasheet.ciiva.com/11821/0900766b80f80784-11821203.pdf?src-supplier=RSComponents; ComponentLink1Description: https://datasheet.ciiva.com/11821/0900766b80f80784-11821203.pdf?src-supplier=RSComponents; ComponentLink2URL: https://datasheet.ciiva.com/7942/aoa0000ce2-7942426.pdf?src-supplier=Element14; ComponentLink2Description: https://datasheet.ciiva.com/7942/aoa0000ce2-7942426.pdf?src-supplier=Element14; ComponentLink3URL: https://datasheet.ciiva.com/16523/aoa0000ce2-16523834.pdf?src-supplier=Avnet+Asia; ComponentLink3Description: https://datasheet.ciiva.com/16523/aoa0000ce2-16523834.pdf?src-supplier=Avnet+Asia; ComponentLink4URL: https://datasheet.ciiva.com/17215/aoa0000ce2-17215308.pdf?src-supplier=Avnet+Europe; ComponentLink4Description: https://datasheet.ciiva.com/17215/aoa0000ce2-17215308.pdf?src-supplier=Avnet+Europe; ComponentLink5URL: https://datasheet.ciiva.com/22673/1678782-22673916.pdf?src-supplier=Element14; ComponentLink5Description: https://datasheet.ciiva.com/22673/1678782-22673916.pdf?src-supplier=Element14; ComponentLink6URL: https://datasheet.ciiva.com/28532/1678782-28532109.pdf?src-supplier=Element14; ComponentLink6Description: https://datasheet.ciiva.com/28532/1678782-28532109.pdf?src-supplier=Element14; ComponentLink7URL: https://datasheet.ciiva.com/16767/70260748-16767559.pdf?src-supplier=Allied+Electronics; ComponentLink7Description: https://datasheet.ciiva.com/16767/70260748-16767559.pdf?src-supplier=Allied+Electronics; ComponentLink8URL: https://datasheet.ciiva.com/9198/aoa0000ce2-9198920.pdf?src-supplier=Avnet; ComponentLink8Description: https://datasheet.ciiva.com/9198/aoa0000ce2-9198920.pdf?src-supplier=Avnet; ComponentLink9URL: https://datasheet.ciiva.com/16771/70260748-16771979.pdf?src-supplier=Allied+Electronics; ComponentLink9Description: https://datasheet.ciiva.com/16771/70260748-16771979.pdf?src-supplier=Allied+Electronics
R182 R191 R200 R209 R228 = Resistor: Manufacturer: Panasonic; Manufacturer Part Number: ERJ-2RKF1021X; Tolerance: 1%; Temperature Coefficient: 100ppm/°C; Power Rating: 100mW; Voltage Rating: 50V; Supplier 1: Digi-Key; Supplier Part Number 1: P1.02KLCT-ND; Stock 1: 88589; Pricing 1: 1 = 0,10000, 10 = 0,04300, 100 = 0,01750, 1000 = 0,00787, 2500 = 0,00683, 5000 = 0,00564 (USD); RoHS: Yes; Mount: Surface Mount; Case/Package: 0402; Case Code (Metric): 1005; Case Code (Imperial): 0402; Contact Plating: Tin; Min Operating Temperature: -55°C; Max Operating Temperature: 155°C; Resistance: 1.02kR; Packaging: Tape and Reel; Composition: Thick Film; Number of Terminations: 2; Voltage Rating (DC): 50V; Max Power Dissipation: 100mW; Features: Automotive AEC-Q200; Package Quantity: 1; Termination: SMD/SMT; Military Standard: Not; Length: 1mm; Height: 0.35mm; Width: 0.02inch; Depth: 0.5mm; REACH SVHC: No SVHC; Lead Free: Lead Free; ComponentLink1URL: https://datasheet.ciiva.com/16760/70260748-16760677.pdf?src-supplier=Allied+Electronics; ComponentLink1Description: https://datasheet.ciiva.com/16760/70260748-16760677.pdf?src-supplier=Allied+Electronics; ComponentLink2URL: https://datasheet.ciiva.com/24026/aoa0000ce2-24026598.pdf?src-supplier=Mouser; ComponentLink2Description: https://datasheet.ciiva.com/24026/aoa0000ce2-24026598.pdf?src-supplier=Mouser; ComponentLink3URL: https://datasheet.ciiva.com/22743/1678782-22743480.pdf?src-supplier=Farnell; ComponentLink3Description: https://datasheet.ciiva.com/22743/1678782-22743480.pdf?src-supplier=Farnell; ComponentLink4URL: https://datasheet.ciiva.com/16778/70260748-16778748.pdf?src-supplier=Allied+Electronics; ComponentLink4Description: https://datasheet.ciiva.com/16778/70260748-16778748.pdf?src-supplier=Allied+Electronics; ComponentLink5URL: https://datasheet.ciiva.com/22682/1678782-22682413.pdf?src-supplier=Element14; ComponentLink5Description: https://datasheet.ciiva.com/22682/1678782-22682413.pdf?src-supplier=Element14; ComponentLink6URL: https://datasheet.ciiva.com/46373/1678782-46373838.pdf?src-supplier=Element14; ComponentLink6Description: https://datasheet.ciiva.com/46373/1678782-46373838.pdf?src-supplier=Element14; ComponentLink7URL: https://datasheet.ciiva.com/46373/1678782-46373839.pdf?src-supplier=Element14; ComponentLink7Description: https://datasheet.ciiva.com/46373/1678782-46373839.pdf?src-supplier=Element14
U17 U20-U23 = FPF2895CUCX: Current Limit Load Switch with OVP and TRCB, 28 V, 5 A; Manufacturer 1: ON Semiconductor; Supplier 1: Mouser; Manufacturer Part Number 1: FPF2895CUCX; Stock 1: 808; Pricing 1: 1=2,18000, 10=1,85000, 100=1,48000, 500=1,29000, 1000=1,07000, 3000=1,00000, 6000=0,96500, 9000=0,92800, 24000=0,89200 (USD); RoHS: No

## Sheet Pomiar_pradu_napiecia.SchDoc: Pomiar prądu
size A3
Used 11 times, as channels HighSpeed/Power4HighSpeed/U_Pomiar_pradu_napiecia_PCIe0, HighSpeed/Power4HighSpeed/U_Pomiar_pradu_napiecia_PCIe1, HighSpeed/Power4HighSpeed/U_Pomiar_pradu_napiecia_PCIe2, HighSpeed/Power4HighSpeed/U_Pomiar_pradu_napiecia_PCIe3, HighSpeed/Power4HighSpeed/U_Pomiar_pradu_napiecia_PCIe4, PowerDistribition/HiCurrent/U_Pomiar_pradu_napiecia_3, PowerDistribition/HiCurrent/U_Pomiar_pradu_napiecia_4, PowerDistribition/HiCurrent/U_Pomiar_pradu_napiecia_5, PowerDistribition/HiCurrent/U_Pomiar_pradu_napiecia_6, PowerDistribition/U_Pomiar_pradu_napiecia_1, PowerDistribition/U_Pomiar_pradu_napiecia_2. Parts and nets are listed once, with the designators drawn on the sheet.
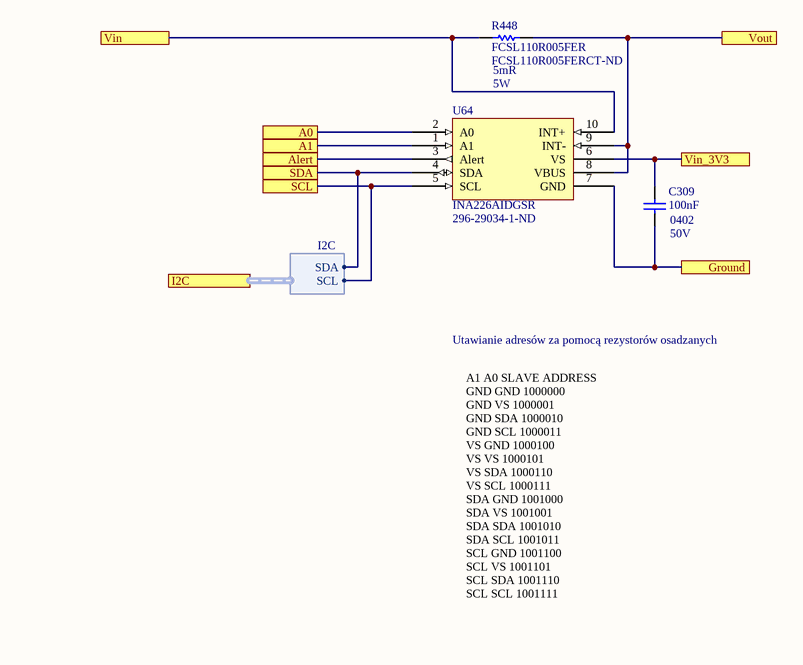
[diagram p19: Pomiar_pradu_napiecia.SchDoc]

### Parts
C309  100nF  Case Code (Imperial): 0402  Voltage: 50V  [CAP 0402/1005 KK]
R448  FCSL110R005FER  Max Power Dissipation: 5W  Resistance: 5mR  [FCSL110R005FERCT-ND]
U64  INA226AIDGSR  Supplier Part Number 1: 296-29034-1-ND  [INA226]

### Ports
A0, A1, Alert, Ground, I2C (harness I2C), SCL, SDA, Vin, Vin_3V3, Vout

### Harnesses
I2C: SCL, SDA

### Nets
A0: U64.2(A0) ; port A0
A1: U64.1(A1) ; port A1
Alert: U64.3(Alert) ; port Alert
Ground: C309.1 U64.7(GND) ; port Ground
SCL: U64.5(SCL) ; port SCL, port I2C.SCL
SDA: U64.4(SDA) ; port SDA, port I2C.SDA
Vin: R448.1 U64.10(INT+) ; port Vin
Vin_3V3: C309.2 U64.6(VS) ; port Vin_3V3
Vout: R448.2 U64.8(VBUS) U64.9(INT-) ; port Vout

### Channels
HighSpeed/Power4HighSpeed/U_Pomiar_pradu_napiecia_PCIe0: designators end in _U_Pomiar_pradu_napiecia_PCIe0; ports A0=NetR174_1 A1=NetR178_1 Alert=P4HS_PowerAlert_Pcie0 Ground=B503_Ground SCL=HiSpeedModule_I2C6.SCL SDA=HiSpeedModule_I2C6.SDA Vin=12V_PCIE0 Vin_3V3=3V3_RAIL Vout=12V_PCIE0_CM
HighSpeed/Power4HighSpeed/U_Pomiar_pradu_napiecia_PCIe1: designators end in _U_Pomiar_pradu_napiecia_PCIe1; ports A0=NetR183_1 A1=NetR187_1 Alert=P4HS_PowerAlert_Pcie1 Ground=B503_Ground SCL=HiSpeedModule_I2C0.SCL SDA=HiSpeedModule_I2C0.SDA Vin=12V_PCIE1 Vin_3V3=3V3_RAIL Vout=12V_PCIE1_CM
HighSpeed/Power4HighSpeed/U_Pomiar_pradu_napiecia_PCIe2: designators end in _U_Pomiar_pradu_napiecia_PCIe2; ports A0=NetR192_1 A1=NetR196_1 Alert=P4HS_PowerAlert_Pcie2 Ground=B503_Ground SCL=HiSpeedModule_I2C6.SCL SDA=HiSpeedModule_I2C6.SDA Vin=12V_PCIE2 Vin_3V3=3V3_RAIL Vout=12V_PCIE2_CM
HighSpeed/Power4HighSpeed/U_Pomiar_pradu_napiecia_PCIe3: designators end in _U_Pomiar_pradu_napiecia_PCIe3; ports A0=NetR201_1 A1=NetR205_1 Alert=P4HS_PowerAlert_Pcie3 Ground=B503_Ground SCL=HiSpeedModule_I2C7.SCL SDA=HiSpeedModule_I2C7.SDA Vin=12V_PCIE3 Vin_3V3=3V3_RAIL Vout=12V_PCIE3_CM
HighSpeed/Power4HighSpeed/U_Pomiar_pradu_napiecia_PCIe4: designators end in _U_Pomiar_pradu_napiecia_PCIe4; ports A0=NetR210_1 A1=NetR217_1 Alert=P4HS_PowerAlert_Pcie4 Ground=B503_Ground SCL=HiSpeedModule_I2C0.SCL SDA=HiSpeedModule_I2C0.SDA Vin=12V_PCIE4 Vin_3V3=3V3_RAIL Vout=12V_PCIE4_CM
PowerDistribition/HiCurrent/U_Pomiar_pradu_napiecia_3: designators end in _U_Pomiar_pradu_napiecia_3; ports A0=NetR561_1 A1=NetR565_1 Alert=NetR860_2 Ground=B503_Ground SCL=SFP_I2C5.SCL SDA=SFP_I2C5.SDA Vin=Vout1_1 Vin_3V3=3V3_RAIL Vout=3V3_RAIL
PowerDistribition/HiCurrent/U_Pomiar_pradu_napiecia_4: designators end in _U_Pomiar_pradu_napiecia_4; ports A0=NetR569_1 A1=NetR573_1 Alert=NetR862_2 Ground=B503_Ground SCL=SFP_I2C5.SCL SDA=SFP_I2C5.SDA Vin=Vout2_1 Vin_3V3=3V3_RAIL Vout=RAM_Vcc1V2
PowerDistribition/HiCurrent/U_Pomiar_pradu_napiecia_5: designators end in _U_Pomiar_pradu_napiecia_5; ports A0=NetR577_1 A1=NetR581_1 Alert=NetR863_2 Ground=B503_Ground SCL=SFP_I2C5.SCL SDA=SFP_I2C5.SDA Vin=Vout1_2 Vin_3V3=3V3_RAIL Vout=12V_LT3042
PowerDistribition/HiCurrent/U_Pomiar_pradu_napiecia_6: designators end in _U_Pomiar_pradu_napiecia_6; ports A0=NetR585_1 A1=NetR589_1 Alert=NetR864_2 Ground=B503_Ground SCL=SFP_I2C5.SCL SDA=SFP_I2C5.SDA Vin=Vout2_2 Vin_3V3=3V3_RAIL Vout=5V_RAIL
PowerDistribition/U_Pomiar_pradu_napiecia_1: designators end in _U_Pomiar_pradu_napiecia_1; ports A0=NetR229_1 A1=NetR461_1 Alert=PWR_PowerAlert0 Ground=B503_Ground SCL=SFP_I2C5.SCL SDA=SFP_I2C5.SDA Vin=Power1_In Vin_3V3=3V3_RAIL Vout=Power1_In_CM
PowerDistribition/U_Pomiar_pradu_napiecia_2: designators end in _U_Pomiar_pradu_napiecia_2; ports A0=NetR467_1 A1=NetR595_1 Alert=PWR_PowerAlert1 Ground=B503_Ground SCL=SFP_I2C5.SCL SDA=SFP_I2C5.SDA Vin=Power2_In Vin_3V3=3V3_RAIL Vout=Power2_In_CM

### Notes on the sheet
- Utawianie adresów za pomocą rezystorów osadzanych
- A1 A0 SLAVE ADDRESS
  GND GND 1000000
  GND VS 1000001
  GND SDA 1000010
  GND SCL 1000011
  VS GND 1000100
  VS VS 1000101
  VS SDA 1000110
  VS SCL 1000111
  SDA GND 1001000
  SDA VS 1001001
  SDA SDA 1001010
  SDA SCL 1001011
  SCL GND 1001100
  SCL VS 1001101
  SCL SDA 1001110
  SCL SCL 1001111
- Title
- Size:
- Date:
- A3
- Number:
- Time:
- Revision:
- Sheet
- of
- File:

### Library data of the parts
C309 = Capacitor: CAP CER 0.1UF 50V X5R 0402; Manufacturer: Murata; Manufacturer Part Number: GRM155R61H104KE14D; Dielectric Material: Ceramic; Dissipation Factor: 0.025%; Tolerance: 10%; Supplier 1: Digi-Key; Supplier Part Number 1: 490-10697-1-ND; RoHS: Yes; Category: Ceramic Capacitors; Stock 1: 435607; Pricing 1: 1=0,10000, 10=0,04600, 100=0,02050, 500=0,01464, 1000=0,01150, 2500=0,01045, 5000=0,00961 (USD); Mount: Surface Mount; Case/Package: 0402; Weight: 0.000212oz; Case Code (Metric): 1005; Min Operating Temperature: -55°C; Max Operating Temperature: 85°C; Capacitance: 100nF; Packaging: Tape and Reel; Voltage Rating: 50V; Dielectric: X5R; Termination: SMD/SMT; Composition: Ceramic; Voltage Rating (DC): 50V; Package Quantity: 10000; Length: 1mm; Height: 0.5mm; Width: 0.02inch; Thickness: 0.022inch; Depth: 0.5mm; REACH SVHC: No SVHC; Lead Free: Lead Free; ComponentLink1URL: http://www.farnell.com/datasheets/2079150.pdf?src-supplier=Farnell; ComponentLink1Description: http://www.farnell.com/datasheets/2079150.pdf?src-supplier=Farnell; ComponentLink2URL: http://www.mouser.com/ds/2/281/c02e-2905.pdf?src-supplier=Mouser; ComponentLink2Description: http://www.mouser.com/ds/2/281/c02e-2905.pdf?src-supplier=Mouser; ComponentLink3URL: http://www.farnell.com/datasheets/2079150.pdf?src-supplier=Element14; ComponentLink3Description: http://www.farnell.com/datasheets/2079150.pdf?src-supplier=Element14; ComponentLink4URL: http://search.murata.co.jp/Ceramy/image/img/A01X/G101/ENG/GRM155R61H104KE14-01.pdf?src-supplier=Digi-Key; ComponentLink4Description: http://search.murata.co.jp/Ceramy/image/img/A01X/G101/ENG/GRM155R61H104KE14-01.pdf?src-supplier=Digi-Key
R448 = FCSL110R005FER: RES SMD 5 MOHM 5W 4320 WIDE; Manufacturer: Ohmite; Tolerance: 1%; Temperature Coefficient: 50ppm/°C; Supplier 1: Digi-Key; Manufacturer Part Number: FCSL110R005FER; Stock 1: 3877; Pricing 1: 1 = 2,79000, 10 = 2,47700, 25 = 2,29720, 50 = 2,16220, 100 = 1,89190, 250 = 1,62164, 500 = 1,35136 (USD); RoHS: Yes; Case/Package: Metal; Number of Pins: 2; Min Operating Temperature: -55°C; Max Operating Temperature: 155°C; Packaging: Tape and Reel; Package Quantity: 1; Features: Moisture Resistant; Power Rating: 5W; Termination: SMD/SMT; Composition: Metal Foil; Number of Terminations: 2; Length: 0.197inch; Height: 0.028inch; Width: 11mm; Depth: 5mm; REACH SVHC: Unknown; ComponentLink1URL: https://datasheet.ciiva.com/2484/res-fcsl-2484643.pdf?src-supplier=Digi-Key; ComponentLink1Description: https://datasheet.ciiva.com/2484/res-fcsl-2484643.pdf?src-supplier=Digi-Key; ComponentLink2URL: https://datasheet.ciiva.com/2484/res-fcsl-2484644.pdf?src-supplier=Digi-Key; ComponentLink2Description: https://datasheet.ciiva.com/2484/res-fcsl-2484644.pdf?src-supplier=Digi-Key; ComponentLink3URL: https://datasheet.ciiva.com/2484/res-fcsl-2484645.pdf?src-supplier=Digi-Key; ComponentLink3Description: https://datasheet.ciiva.com/2484/res-fcsl-2484645.pdf?src-supplier=Digi-Key; ComponentLink4URL: https://datasheet.ciiva.com/6181/fcsl-6181333.pdf?src-supplier=Farnell; ComponentLink4Description: https://datasheet.ciiva.com/6181/fcsl-6181333.pdf?src-supplier=Farnell; ComponentLink5URL: https://datasheet.ciiva.com/46422/1812595-46422917.pdf?src-supplier=Element14; ComponentLink5Description: https://datasheet.ciiva.com/46422/1812595-46422917.pdf?src-supplier=Element14; ComponentLink6URL: https://datasheet.ciiva.com/8080/fcsl-8080343.pdf?src-supplier=Element14; ComponentLink6Description: https://datasheet.ciiva.com/8080/fcsl-8080343.pdf?src-supplier=Element14; Supplier Part Number 1: FCSL110R005FERCT-ND
U64 = INA226AIDGSR: IC MONITOR PWR/CURR BIDIR 10MSOP; Manufacturer: Texas Instruments; Min Supply Voltage: 2.7V; Max Supply Voltage: 5.5V; Nominal Supply Current: 330uA; Common Mode Rejection Ratio: 140dB; Output Current: 10mA; Input Bias Current: 10uA; Input Offset Voltage (Vos): 2.5uV; Accuracy: 0.02%; Supplier 1: Digi-Key; Manufacturer Part Number: INA226AIDGSR; Stock 1: 62024; Pricing 1: 1 = 2,88000, 10 = 2,58900, 100 = 2,12100, 500 = 1,80554, 1000 = 1,52275 (USD); RoHS: Yes; Mount: Surface Mount; Case/Package: VSSOP; Number of Pins: 10; Contact Plating: Gold; Min Operating Temperature: -40°C; Max Operating Temperature: 125°C; Packaging: Tape and Reel; Package Quantity: 1; Radiation Hardening: No; REACH SVHC: No SVHC; Lead Free: Lead Free; ComponentLink1URL: https://datasheet.ciiva.com/1939/ina226-1939633.pdf?src-supplier=Digi-Key; ComponentLink1Description: https://datasheet.ciiva.com/1939/ina226-1939633.pdf?src-supplier=Digi-Key; ComponentLink2URL: https://datasheet.ciiva.com/4875/sbos547-126280-4875559.pdf?src-supplier=Mouser; ComponentLink2Description: https://datasheet.ciiva.com/4875/sbos547-126280-4875559.pdf?src-supplier=Mouser; ComponentLink3URL: https://datasheet.ciiva.com/1939/ina226-1939634.pdf?src-supplier=Digi-Key; ComponentLink3Description: https://datasheet.ciiva.com/1939/ina226-1939634.pdf?src-supplier=Digi-Key; ComponentLink4URL: https://datasheet.ciiva.com/1939/ina226-1939635.pdf?src-supplier=Digi-Key; ComponentLink4Description: https://datasheet.ciiva.com/1939/ina226-1939635.pdf?src-supplier=Digi-Key; ComponentLink5URL: https://datasheet.ciiva.com/14196/ina226-14196741.pdf?src-supplier=Avnet; ComponentLink5Description: https://datasheet.ciiva.com/14196/ina226-14196741.pdf?src-supplier=Avnet; ComponentLink6URL: https://datasheet.ciiva.com/22693/1840205-22693516.pdf?src-supplier=Element14; ComponentLink6Description: https://datasheet.ciiva.com/22693/1840205-22693516.pdf?src-supplier=Element14